# Altium project LED_Christmas_Tree.PrjPcb
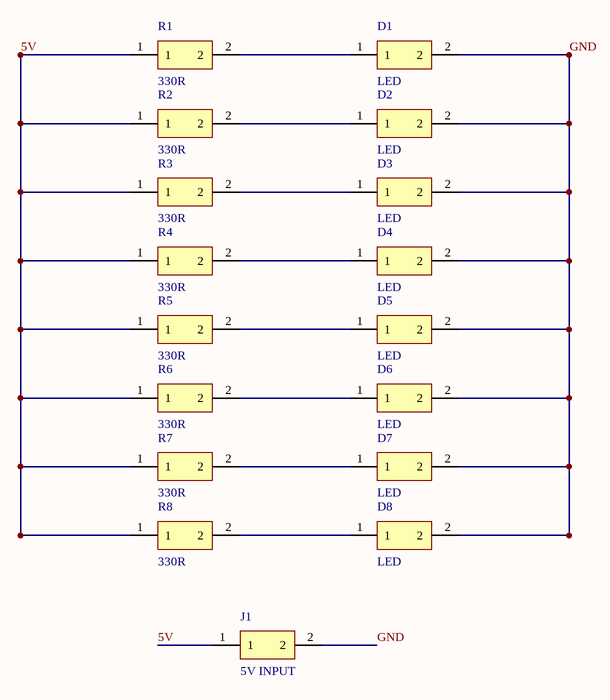
[diagram p0: Christmas_Tree.SchDoc]
1 sheet, 17 parts. Net scope: global (net labels, ports and power ports of the same name join across sheets).
Board file: Christmas_Tree.PcbDoc

## Sheet Christmas_Tree.SchDoc
size A4

### Parts
D1  LED  [LED_5MM_2P54]
D2  LED  [LED_5MM_2P54]
D3  LED  [LED_5MM_2P54]
D4  LED  [LED_5MM_2P54]
D5  LED  [LED_5MM_2P54]
D6  LED  [LED_5MM_2P54]
D7  LED  [LED_5MM_2P54]
D8  LED  [LED_5MM_2P54]
J1  5V INPUT  [WIRE_2P_10MM]
R1  330R  [RES_AXIAL_7P62]
R2  330R  [RES_AXIAL_7P62]
R3  330R  [RES_AXIAL_7P62]
R4  330R  [RES_AXIAL_7P62]
R5  330R  [RES_AXIAL_7P62]
R6  330R  [RES_AXIAL_7P62]
R7  330R  [RES_AXIAL_7P62]
R8  330R  [RES_AXIAL_7P62]

### Nets
5V: J1.1 R1.1 R2.1 R3.1 R4.1 R5.1 R6.1 R7.1 R8.1
GND: D1.2 D2.2 D3.2 D4.2 D5.2 D6.2 D7.2 D8.2 J1.2
NetD1_1: D1.1 R1.2
NetD2_1: D2.1 R2.2
NetD3_1: D3.1 R3.2
NetD4_1: D4.1 R4.2
NetD5_1: D5.1 R5.2
NetD6_1: D6.1 R6.2
NetD7_1: D7.1 R7.2
NetD8_1: D8.1 R8.2

### Library data of the parts
J1 = CONNECTOR
R1-R8 = RESISTOR